# Altium schematic sheet Connectors.SchDoc
size A4; SheetNumber: 6; SheetTotal: 7
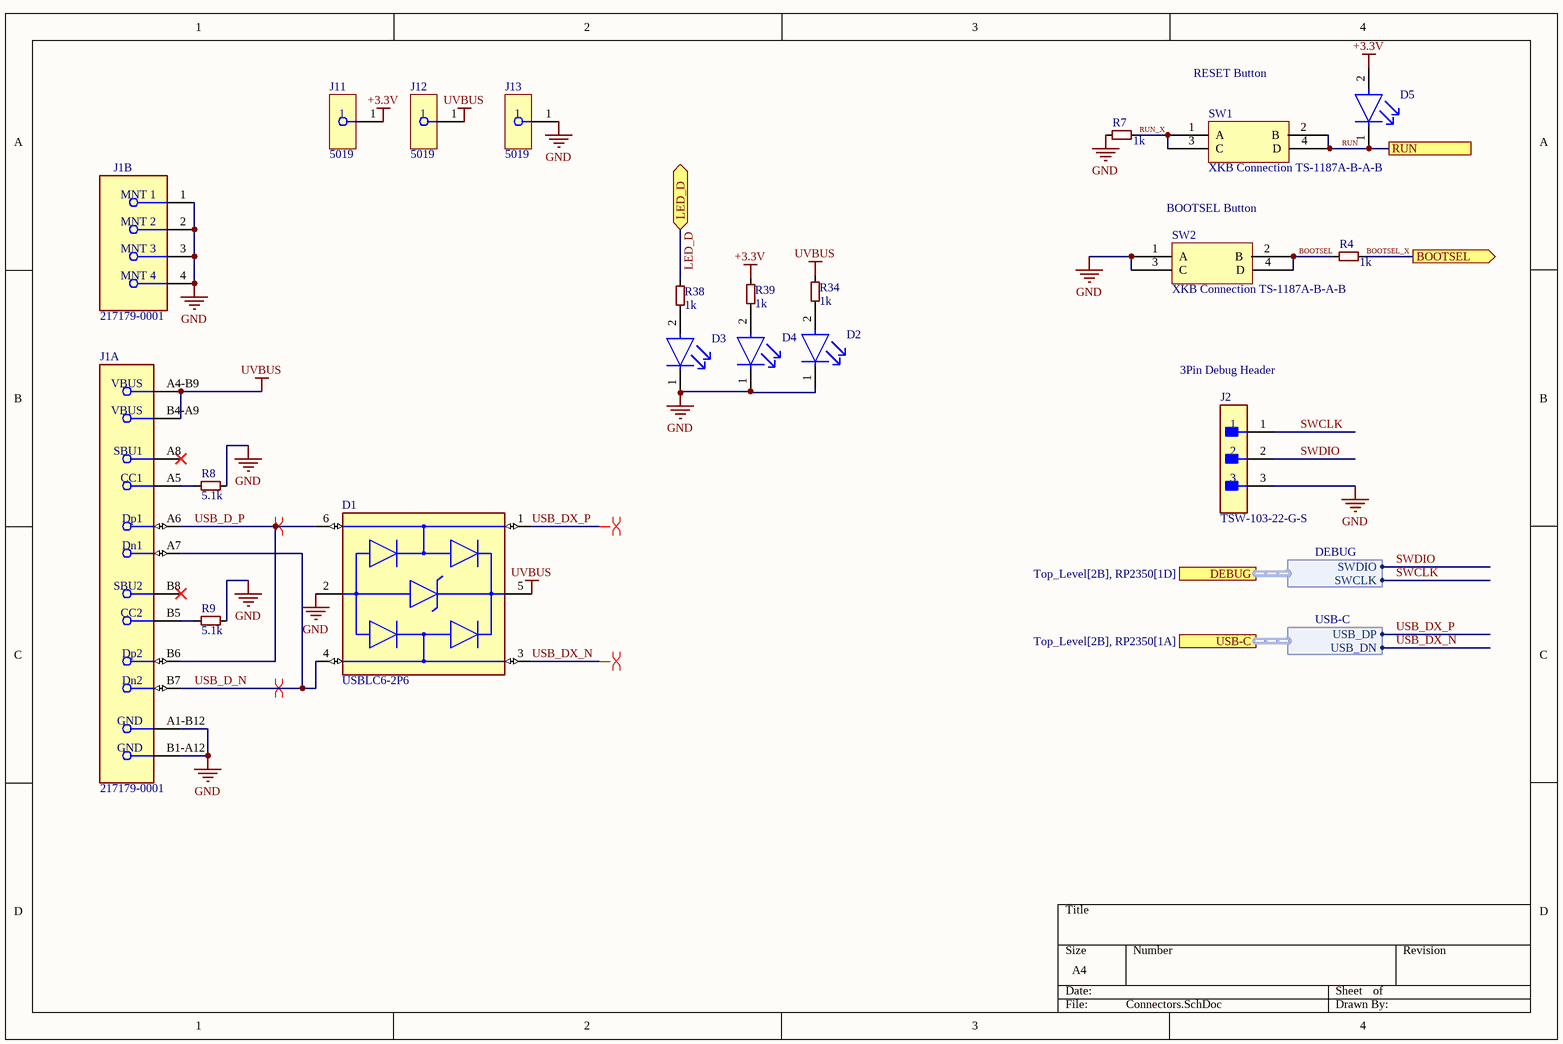
[diagram p0: Connectors.SchDoc]

## Parts
D1  USBLC6-2P6  [FP-SOT-666-MFG]
D2  LSM0603453V  [FP-LSM0603453V-MFG]  (value not drawn)
D3  LSM0603453V  [FP-LSM0603453V-MFG]  (value not drawn)
D4  LSM0603453V  [FP-LSM0603453V-MFG]  (value not drawn)
D5  LSM0603453V  [FP-LSM0603453V-MFG]  (value not drawn)
J1  217179-0001  [FP-2171790001-MFG]  (parts A,B of 2)
J2  TSW-103-22-G-S  [FP-TSW-103-22-G-S-MFG]
J11  5019  [5019_MFG]
J12  5019  [5019_MFG]
J13  5019  [5019_MFG]
R4  R: 1k  [0402 Resistor]  (hidden comment: FRC0402F1001TS)
R7  R: 1k  [0402 Resistor]  (hidden comment: FRC0402F1001TS)
R8  R: 5.1k  [0402 Resistor]  (hidden comment: FRC0402F5101TS)
R9  R: 5.1k  [0402 Resistor]  (hidden comment: FRC0402F5101TS)
R34  R: 1k  [0402 Resistor]  (hidden comment: FRC0402F1001TS)
R38  R: 1k  [0402 Resistor]  (hidden comment: FRC0402F1001TS)
R39  R: 1k  [0402 Resistor]  (hidden comment: FRC0402F1001TS)
SW1  XKB Connection TS-1187A-B-A-B  [Push_Button]
SW2  XKB Connection TS-1187A-B-A-B  [Push_Button]

## Ports
BOOTSEL (out, see Top_Level[2A], Peripherials[1A]), DEBUG (harness DEBUG, see Top_Level[2B], RP2350[1D]), LED_D (bidir, see Top_Level[2B], RP2350[3B]), RUN (see Top_Level[2B], RP2350[2D]), USB-C (harness USB-C, see Top_Level[2B], RP2350[1A])

## Harnesses
DEBUG: SWDIO, SWCLK
USB-C: USB_DP, USB_DN

## Nets
+3.3V: D5.2(A) J11.1 R39.2
GND: D1.2(GND) D2.1(C) D3.1(C) D4.1(C) J1.1(MNT_1) J1.2(MNT_2) J1.3(MNT_3) J1.4(MNT_4) J1.A1-B12(GND) J1.B1-A12(GND) J2.3 J13.1 R7.1 R8.2 R9.2 SW2.1(A) SW2.3(C)
UVBUS: D1.5(VBUS) J1.A4-B9(VBUS) J1.B4-A9(VBUS) J12.1 R34.2
BOOTSEL: R4.1 SW2.2(B) SW2.4(D)
BOOTSEL_X: R4.2 ; port BOOTSEL
LED_D: R38.2 ; port LED_D
RUN: D5.1(C) SW1.2(B) SW1.4(D) ; port RUN
RUN_X: R7.2 SW1.1(A) SW1.3(C)
SWCLK: J2.1 ; port DEBUG.SWCLK
SWDIO: J2.2 ; port DEBUG.SWDIO
USB_D_N: D1.4(I/O2) J1.A7(Dn1) J1.B7(Dn2)
USB_D_P: D1.6(I/O1) J1.A6(Dp1) J1.B6(Dp2)
USB_DX_N: D1.3(I/O2) ; port USB-C.USB_DN
USB_DX_P: D1.1(I/O1) ; port USB-C.USB_DP
NetD2_2: D2.2(A) R34.1
NetD3_2: D3.2(A) R38.1
NetD4_2: D4.2(A) R39.1
NetJ1_A5: J1.A5(CC1) R8.1
NetJ1_B5: J1.B5(CC2) R9.1

Not connected (* = marked no-connect by the designer): J1 A8(SBU1)* B8(SBU2)*

## Layout directives
differential pair: USB_D_N, USB_D_P, USB_DX_N, USB_DX_P

## Notes on the sheet
- RESET Button
- BOOTSEL Button
- 3Pin Debug Header

## Library data of the parts
D1 = CMP-12225-000058-1: TVS DIODE 5.25V 17V SOT666; Min Breakdown Voltage: 6V; Power Line Protection: Yes; Element Configuration: Dual; Test Current: 1mA; Working Voltage: 5V; Number of Channels: 2; Max Reverse Leakage Current: 150nA; Direction: Unidirectional; Peak Pulse Current: 5A; Number of Elements: 1; Capacitance: 3.5pF; Max Breakdown Voltage: 6V; Height: 0.6mm; Depth: 1.3mm; Contact Plating: Tin; Reverse Breakdown Voltage: 6V; REACH SVHC: No SVHC; Operating Supply Voltage: 5V; Width: 1.3mm; Max Operating Temperature: 125°C; Reverse Standoff Voltage: 5V; ESD Protection: Yes; Package Quantity: 1; Termination: SMD/SMT; Length: 1.7mm; Leakage Current: 150nA; Number of Bidirectional Channels: 2; Case/Package: SOT-666; Min Operating Temperature: -40°C; Number of Pins: 6; Clamping Voltage: 17V; Breakdown Voltage: 6V; Lead Free: Lead Free; Radiation Hardening: No; Packaging: Tape and Reel; Mount: Surface Mount; Polarity: Unidirectional; LCSC Part #: C15999
D2-D5 = CMP-00731-94024739-1: LSM0603453V LED SM 0603 3V -/1000/-mcd Green; Forward Current: 20mA; Forward Voltage: 2.3V; Viewing Angle: 120°; Reverse Voltage: 5V; Power Dissipation: 60mW; Wavelength: 576nm; Luminous Intensity: 120mcd; NexarPartId: 94024739; Height: 550µm; Max Operating Temperature: 85°C; Schedule B: 8541402000, 8541406050; Case/Package: 0603; Color: Green; Min Operating Temperature: -40°C; LCSC Part #: C19171390
J1 = CMP-04767-000028-2: CONN RCP USB2.0 TYP C 24P SMD RA; NexarPartId: 117190526; Gender: Receptacle; Number of Contacts: 16; Current Rating: 1.25A; Voltage Rating: 30V; Min Operating Temperature: -40°C; USB Standard: USB 2.0; Height: 3.36mm; Contact Material: Gold, Nickel; Max Operating Temperature: 85°C; LCSC Part #: C3197684
J2 = CMP-02766-000544-1: Conn Unshrouded Header HDR 3 POS 2.54mm Solder ST Thru-Hole Bulk; Max Current Rating: 7.6A; Gender: Male; Max Voltage Rating (AC): 550V; Number of Contacts: 3; Orientation: Straight; REACH SVHC: No SVHC; Pitch: 2.54mm; Termination: Solder; Length: 7.62mm; Contact Material: Bronze; Housing Color: Black; Housing Material: Polyester; Number of Rows: 1; Contact Plating: Gold; Min Operating Temperature: -55°C; Packaging: Bulk; Depth: 2.54mm; Max Operating Temperature: 125°C
J11-J13 = CMP-1672-00008-3: Phosphor Bronze Contact Miniature Silver Plated Surface Mount Test Points; Number of Contacts: 1; ComponentLink1Description: Manufacturer's Website; Number of Pins: 1; Height: 2.42mm; Mount: Surface Mount; HelpURL: https://www.keyelco.com/product-pdf.cfm?p=1357; REACH SVHC: Yes; Packaging: Tape and Reel; Lead Free: Lead Free; ComponentLink1URL: http://www.keyelco.com/; Termination: SMD/SMT; Material: Bronze; Contact Plating: Silver; Contact Material: Silver; RoHS: Compliant; ComponentLink2URL: https://www.keyelco.com/product-pdf.cfm?p=1357; China RoHS: Compliant; Lifecycle Status: Production; ComponentLink2Description: Datasheet URL
R4 R7 R34 R38 R39 = FRC0402F1001TS: RES 1kΩ ±1% 62.5mW 0402; LCSC Part #: C2906864
R8 R9 = FRC0402F5101TS: RES 5.1kΩ ±1% 62.5mW 0402; LCSC Part #: C2906874
SW1 SW2 = CMP-011-00013-1: Push Button; Source: ECE362.SchLib; Manufacturer Part Number: TS-1187A-B-A-B; Design Item ID: XKB Connection TS-1187A-B-A-B
  SW1: LCSC Part Number: C318884
  SW2: LCSC Part #: C318884